# Altium schematic sheet FORMULA.SchDoc
size A3; DocumentNumber: ТО2192; SheetNumber: 2; SheetTotal: 4
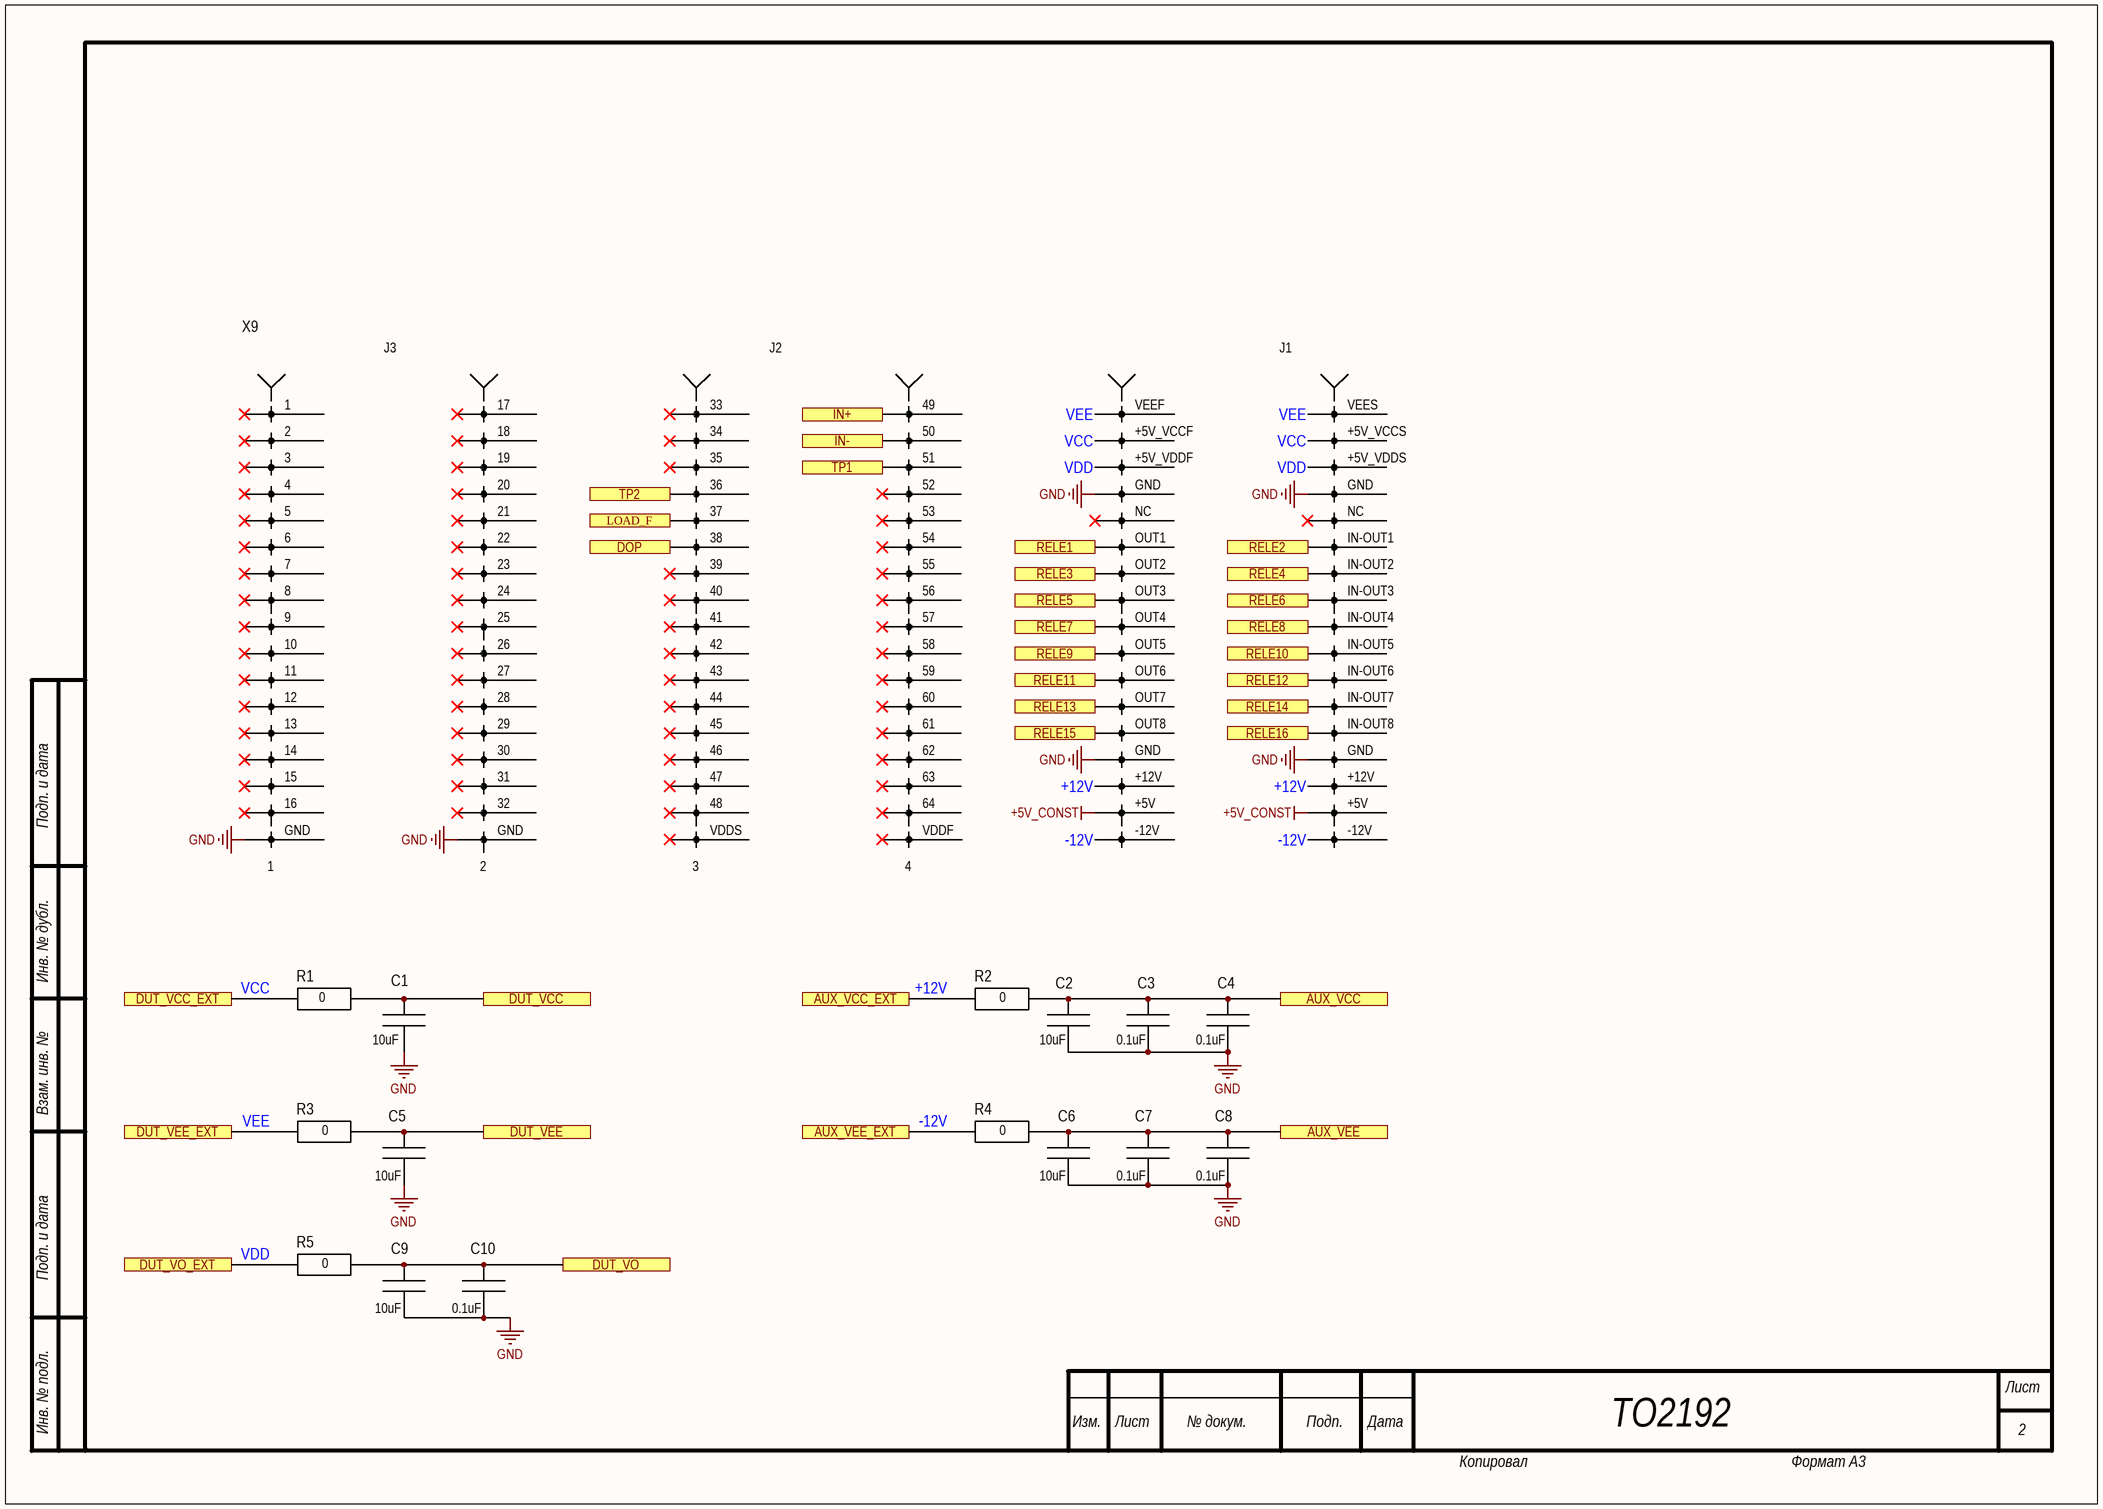
[diagram p0: FORMULA.SchDoc]

## Parts
C1  10uF  [0805]
C2  10uF  [0805]
C3  0.1uF  [0805]
C4  0.1uF  [0805]
C5  10uF  [0805]
C6  10uF  [0805]
C7  0.1uF  [0805]
C8  0.1uF  [0805]
C9  10uF  [0805]
C10  0.1uF  [0805]
R1  0  [0805]
R2  0  [0805]
R3  0  [0805]
R4  0  [0805]
R5  0  [0805]
X9  FORMULA  [FORMULA]  (value not drawn)

## Ports
AUX_VCC, AUX_VCC_EXT, AUX_VEE, AUX_VEE_EXT, DOP, DUT_VCC, DUT_VCC_EXT, DUT_VEE, DUT_VEE_EXT, DUT_VO, DUT_VO_EXT, IN+, IN-, LOAD_F, RELE1, RELE2, RELE3, RELE4, RELE5, RELE6, RELE7, RELE8, RELE9, RELE10, RELE11, RELE12, RELE13, RELE14, RELE15, RELE16, TP1, TP2

## Nets
+5V_CONST: X9.+5V
GND: C1.2 C2.2 C3.2 C4.2 C5.2 C6.2 C7.2 C8.2 C9.2 C10.2 X9.GND
+12V: R2.2 X9.+12V ; port AUX_VCC_EXT
-12V: R4.2 X9.-12V ; port AUX_VEE_EXT
AUX_VCC: C2.1 C3.1 C4.1 R2.1 ; port AUX_VCC
AUX_VEE: C6.1 C7.1 C8.1 R4.1 ; port AUX_VEE
DOP: X9.38 ; port DOP
DUT_VCC: C1.1 R1.2 ; port DUT_VCC
DUT_VEE: C5.1 R3.1 ; port DUT_VEE
DUT_VO: C9.1 C10.1 R5.1 ; port DUT_VO
IN+: X9.49 ; port IN+
IN-: X9.50 ; port IN-
LOAD_F: X9.37 ; port LOAD_F
RELE1: X9.OUT1 ; port RELE1
RELE2: X9.IN-OUT1 ; port RELE2
RELE3: X9.OUT2 ; port RELE3
RELE4: X9.IN-OUT2 ; port RELE4
RELE5: X9.OUT3 ; port RELE5
RELE6: X9.IN-OUT3 ; port RELE6
RELE7: X9.OUT4 ; port RELE7
RELE8: X9.IN-OUT4 ; port RELE8
RELE9: X9.OUT5 ; port RELE9
RELE10: X9.IN-OUT5 ; port RELE10
RELE11: X9.OUT6 ; port RELE11
RELE12: X9.IN-OUT6 ; port RELE12
RELE13: X9.OUT7 ; port RELE13
RELE14: X9.IN-OUT7 ; port RELE14
RELE15: X9.OUT8 ; port RELE15
RELE16: X9.IN-OUT8 ; port RELE16
TP1: X9.51 ; port TP1
TP2: X9.36 ; port TP2
VCC: R1.1 X9.+5V_VCCF(VCCF) X9.+5V_VCCS(VCCS) ; port DUT_VCC_EXT
VDD: R5.2 X9.+5V_VDDF(VDDF) X9.+5V_VDDS(VDDS) ; port DUT_VO_EXT
VEE: R3.2 X9.VEEF X9.VEES ; port DUT_VEE_EXT

Not connected (* = marked no-connect by the designer): X9 1* 2* 3* 4* 5* 6* 7* 8* 9* 10* 11* 12* 13* 14* 15* 16* 17* 18* 19* 20* 21* 22* 23* 24* 25* 26* 27* 28* 29* 30* 31* 32* 33* 34* 35* 39* 40* 41* 42* 43* 44* 45* 46* 47* 48* 52* 53* 54* 55* 56* 57* 58* 59* 60* 61* 62* 63* 64* NC* VDDF* VDDS*

## Notes on the sheet
- Подп. и дата
- Инв. № дубл.
- Взам. инв. №
- Лист
- Инв. № подл.
- Изм.
- № докум.
- Подп.
- Дата
- ТО2192
- 2
- Копировал
- Формат А3
- Перв. примен.
- Справ. №
- Разраб.
- Литера
- Масса
- Масштаб
- Пров.
- Т.контр.
- Листов
- Н.контр.
- Утв.
- Форма 1 ГОСТ 2.104-2006
- (in symbol FORMULA) J3; J2; J1

## Library data of the parts
C1-C10 = C0805: ComponentHeigt: 1.3; Firme: AVX; Leadform: SMD; KIND: Конденсатор; ClassName: *; Component Link: *; ComponentWeigt: *; Packaging: 0805; NN: *; Value: *
R1-R5 = R0805 Yageo: ComponentHeigt: 0.6; Firme: Yageo; Leadform: SMD; Kind: Резистор; ClassName: *; ComponentWeigt: *; Component Link: *; Packaging: 0805; NN: *; Value: *